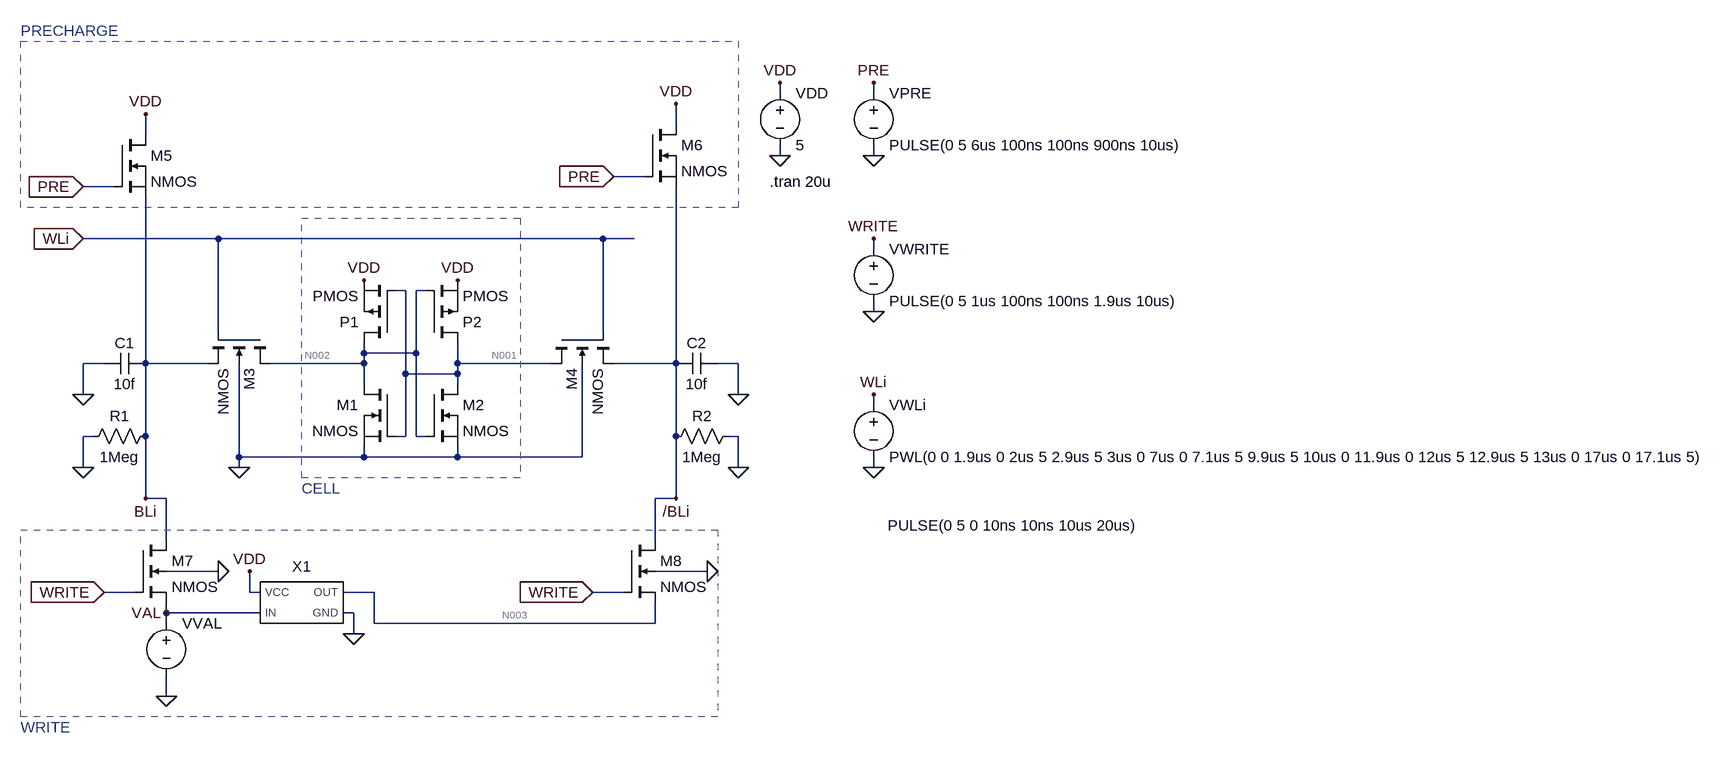
[diagram p0: schematic sram_cell.asc]
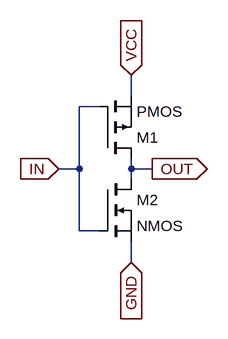
[diagram p1: sub-circuit not.asc]
sram_cell.asc, the LTspice schematic file:
Version 4.1
SHEET 1 2348 816
WIRE 832 -176 832 -192
WIRE 976 -176 976 -192
WIRE 672 -128 672 -160
WIRE -144 -112 -144 -144
WIRE 832 -80 832 -96
WIRE 976 -80 976 -96
WIRE 624 -48 576 -48
WIRE -192 -32 -240 -32
WIRE -32 48 -240 48
WIRE 560 48 -32 48
WIRE 608 48 560 48
WIRE 976 64 976 48
WIRE 256 128 240 128
WIRE 288 128 272 128
WIRE 976 160 976 144
WIRE -32 192 -32 48
WIRE 560 192 560 48
WIRE 192 224 192 208
WIRE 272 224 272 128
WIRE 272 224 192 224
WIRE -208 240 -240 240
WIRE -144 240 -144 -16
WIRE -48 240 -144 240
WIRE 192 240 192 224
WIRE 192 240 48 240
WIRE 336 240 336 208
WIRE 480 240 336 240
WIRE 672 240 672 -32
WIRE 672 240 576 240
WIRE 768 240 736 240
WIRE 256 256 256 128
WIRE 336 256 336 240
WIRE 336 256 256 256
WIRE 192 272 192 240
WIRE 336 272 336 256
WIRE -240 288 -240 240
WIRE 768 288 768 240
WIRE 976 304 976 288
WIRE -224 352 -240 352
WIRE -144 352 -144 240
WIRE 256 352 256 256
WIRE 256 352 240 352
WIRE 272 352 272 224
WIRE 288 352 272 352
WIRE 672 352 672 240
WIRE 768 352 752 352
WIRE 0 384 0 240
WIRE 192 384 192 368
WIRE 192 384 0 384
WIRE 336 384 336 368
WIRE 336 384 192 384
WIRE 528 384 528 240
WIRE 528 384 336 384
WIRE -240 400 -240 352
WIRE 0 400 0 384
WIRE 768 400 768 352
WIRE 976 400 976 384
WIRE -144 448 -144 352
WIRE -112 448 -144 448
WIRE 672 448 672 352
WIRE 672 448 640 448
WIRE -112 512 -112 448
WIRE 640 512 640 448
WIRE -32 560 -112 560
WIRE 720 560 640 560
WIRE -160 592 -208 592
WIRE 16 592 16 560
WIRE 32 592 16 592
WIRE 208 592 160 592
WIRE 592 592 544 592
WIRE -112 624 -112 608
WIRE 32 624 -112 624
WIRE 176 624 160 624
WIRE -112 640 -112 624
WIRE 208 640 208 592
WIRE 640 640 640 608
WIRE 640 640 208 640
WIRE 176 656 176 624
WIRE -112 752 -112 720
FLAG 192 112 VDD
FLAG 336 112 VDD
FLAG 832 -80 0
FLAG 832 -192 VDD
FLAG -240 48 WLi
IOPIN -240 48 In
FLAG 0 400 0
FLAG -240 288 0
FLAG 768 288 0
FLAG -144 448 BLi
FLAG 672 448 /BLi
FLAG -240 -32 PRE
IOPIN -240 -32 In
FLAG -144 -144 VDD
FLAG 576 -48 PRE
IOPIN 576 -48 In
FLAG 672 -160 VDD
FLAG 176 656 0
FLAG -112 752 0
FLAG -208 592 WRITE
IOPIN -208 592 In
FLAG 544 592 WRITE
IOPIN 544 592 In
FLAG 976 -80 0
FLAG 976 -192 PRE
FLAG 976 160 0
FLAG 976 48 WRITE
FLAG 976 400 0
FLAG 976 288 WLi
FLAG -112 624 VAL
FLAG -240 400 0
FLAG 768 400 0
FLAG 16 560 VDD
FLAG -32 560 0
FLAG 720 560 0
SYMBOL pmos 288 208 M180
SYMATTR InstName P2
SYMBOL pmos 240 208 R180
SYMATTR InstName P1
SYMBOL nmos 288 272 R0
SYMATTR InstName M2
SYMBOL nmos 240 272 M0
SYMATTR InstName M1
SYMBOL voltage 832 -192 R0
SYMATTR InstName VDD
SYMATTR Value 5
SYMBOL nmos4 48 192 R90
SYMATTR InstName M3
SYMBOL nmos4 480 192 M90
SYMATTR InstName M4
SYMBOL cap -144 256 M270
WINDOW 0 32 32 VTop 2
WINDOW 3 0 32 VBottom 2
SYMATTR InstName C1
SYMATTR Value 10f
SYMBOL cap 736 224 R90
WINDOW 0 0 32 VBottom 2
WINDOW 3 32 32 VTop 2
SYMATTR InstName C2
SYMATTR Value 10f
SYMBOL nmos -192 -112 R0
SYMATTR InstName M5
SYMBOL nmos 624 -128 R0
SYMATTR InstName M6
SYMBOL voltage -112 624 R0
WINDOW 3 1110 -135 Left 2
WINDOW 123 0 0 Left 0
WINDOW 39 0 0 Left 0
SYMATTR InstName VVAL
SYMATTR Value PULSE(0 5 0 10ns 10ns 10us 20us)
SYMBOL not 96 608 R0
SYMATTR InstName X1
SYMBOL voltage 976 -192 R0
SYMATTR InstName VPRE
SYMATTR Value PULSE(0 5 6us 100ns 100ns 900ns 10us)
SYMBOL voltage 976 48 R0
WINDOW 123 0 0 Left 0
WINDOW 39 0 0 Left 0
SYMATTR InstName VWRITE
SYMATTR Value PULSE(0 5 1us 100ns 100ns 1.9us 10us)
SYMBOL voltage 976 288 R0
WINDOW 123 0 0 Left 0
WINDOW 39 0 0 Left 0
SYMATTR InstName VWLi
SYMATTR Value PWL(0 0 1.9us 0 2us 5 2.9us 5 3us 0 7us 0 7.1us 5 9.9us 5 10us 0 11.9us 0 12us 5 12.9us 5 13us 0 17us 0 17.1us 5)
SYMBOL res -128 336 R90
WINDOW 0 0 56 VBottom 2
WINDOW 3 32 56 VTop 2
SYMATTR InstName R1
SYMATTR Value 1Meg
SYMBOL res 768 336 R90
WINDOW 0 0 56 VBottom 2
WINDOW 3 32 56 VTop 2
SYMATTR InstName R2
SYMATTR Value 1Meg
SYMBOL nmos4 -160 512 R0
SYMATTR InstName M7
SYMBOL nmos4 592 512 R0
SYMATTR InstName M8
TEXT 816 -40 Left 2 !.tran 20u
TEXT -336 -272 Left 2 ;PRECHARGE
TEXT -336 800 Left 2 ;WRITE
TEXT 96 432 Left 2 ;CELL
RECTANGLE Normal 768 0 -336 -256 2
RECTANGLE Normal 736 784 -336 496 2
RECTANGLE Normal 432 416 96 16 2

not.asc, the sub-circuit schematic file:
Version 4.1
SHEET 1 880 680
WIRE 176 48 176 16
WIRE 128 64 96 64
WIRE 96 160 96 64
WIRE 96 160 64 160
WIRE 176 160 176 144
WIRE 208 160 176 160
WIRE 176 176 176 160
WIRE 96 256 96 160
WIRE 128 256 96 256
WIRE 176 304 176 272
FLAG 64 160 IN
IOPIN 64 160 In
FLAG 208 160 OUT
IOPIN 208 160 Out
FLAG 176 16 VCC
IOPIN 176 16 In
FLAG 176 304 GND
IOPIN 176 304 In
SYMBOL pmos 128 144 M180
SYMATTR InstName M1
SYMBOL nmos 128 176 R0
SYMATTR InstName M2

The netlist it stands for:
* sram_cell.asc
M§P2 N001 N002 VDD VDD PMOS
M§P1 N002 N001 VDD VDD PMOS
M2 N001 N002 0 0 NMOS
M1 N002 N001 0 0 NMOS
VDD VDD 0 5
M3 N002 WLi BLi 0 NMOS
M4 N001 WLi /BLi 0 NMOS
C1 BLi 0 10f
C2 0 /BLi 10f
M5 VDD PRE BLi BLi NMOS
M6 VDD PRE /BLi /BLi NMOS
VVAL VAL 0 PULSE(0 5 0 10ns 10ns 10us 20us)
X§X1 0 VAL VDD N003 not
VPRE PRE 0 PULSE(0 5 6us 100ns 100ns 900ns 10us)
VWRITE WRITE 0 PULSE(0 5 1us 100ns 100ns 1.9us 10us)
VWLi WLi 0 PWL(0 0 1.9us 0 2us 5 2.9us 5 3us 0 7us 0 7.1us 5 9.9us 5 10us 0 11.9us 0 12us 5 12.9us 5 13us 0 17us 0 17.1us 5)
R1 BLi 0 1Meg
R2 0 /BLi 1Meg
M7 BLi WRITE VAL 0 NMOS
M8 /BLi WRITE N003 0 NMOS

* block symbol definitions
.subckt not GND IN VCC OUT
M1 OUT IN VCC VCC PMOS
M2 OUT IN GND GND NMOS
.ends not

.model NMOS NMOS
.model PMOS PMOS
.lib standard.mos
.tran 20u
* PRECHARGE
* WRITE
* CELL
.backanno
.end

* Results of the author's LTspice run, read from the files saved beside the schematic
* Operating Point, zero values left out:
*   V(/bli) = 17.51 µV
*   V(bli) = 12.51 µV
*   V(n001) = 2.5 V
*   V(n002) = 2.5 V
*   V(n003) = 5 V
*   V(vdd) = 5 V
*   I(R1) = 12.51 pA
*   I(R2) = -17.51 pA
*   I(VDD) = -125 µA
*   Ib(M1) = -2.51 pA
*   Ib(M2) = -2.51 pA
*   Ib(M3) = -2.51 pA
*   Ib(M4) = -2.51 pA
*   Ib(M5) = -5.01 pA
*   Ib(M6) = -5.01 pA
*   Ib(M8) = -5.01 pA
*   Ib(P1) = 2.51 pA
*   Ib(P2) = 2.51 pA
*   Id(M1) = 62.5 µA
*   Id(M2) = 62.5 µA
*   Id(M3) = 5.01 pA
*   Id(M4) = 5.01 pA
*   Id(M5) = 10.01 pA
*   Id(M6) = 10.01 pA
*   Id(M8) = -5 pA
*   Id(P1) = -62.5 µA
*   Id(P2) = -62.5 µA
*   Is(M1) = -62.5 µA
*   Is(M2) = -62.5 µA
*   Is(M3) = -2.5 pA
*   Is(M4) = -2.5 pA
*   Is(M5) = -5 pA
*   Is(M6) = -5 pA
*   Is(M8) = 10.01 pA
*   Is(P1) = 62.5 µA
*   Is(P2) = 62.5 µA
*   Ix(x1:gnd) = -10.01 pA
*   Ix(x1:out) = 142.7 pA
*   Ix(x1:vcc) = -132.7 pA
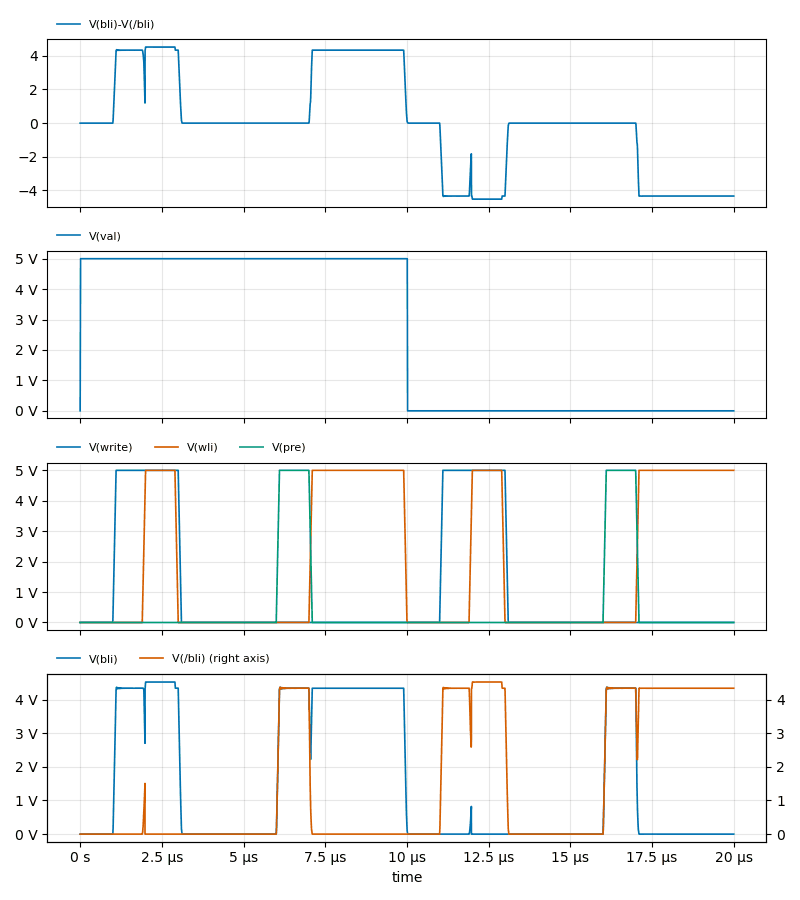
[diagram p2: Transient Analysis of sram_cell.asc, plotted from the saved traces]
* Transient Analysis, 1 run:
*   V(bli)-V(/bli): min -4.525 , max 4.525 , average -10.35 m, rms 3.039 , last -4.34 
*   V(val): min 0 V, max 5 V, average 2.503 V, rms 3.537 V, last 0 V
*   V(write): min 0 V, max 5 V, average 1 V, rms 2.218 V, last 0 V
*   V(wli): min 0 V, max 5 V, average 1.962 V, rms 3.11 V, last 5 V
*   V(pre): min 0 V, max 5 V, average 500 mV, rms 1.555 V, last 0 V
*   V(bli): min -45.55 µV, max 4.525 V, average 1.494 V, rms 2.532 V, last 187.9 µV
*   V(/bli): min -4.631 µ, max 4.525 , average 1.504 , rms 2.542 , last 4.34 